# Altium schematic sheet POE_PSU.SchDoc
size A3; SheetNumber: 15; SheetTotal: 16
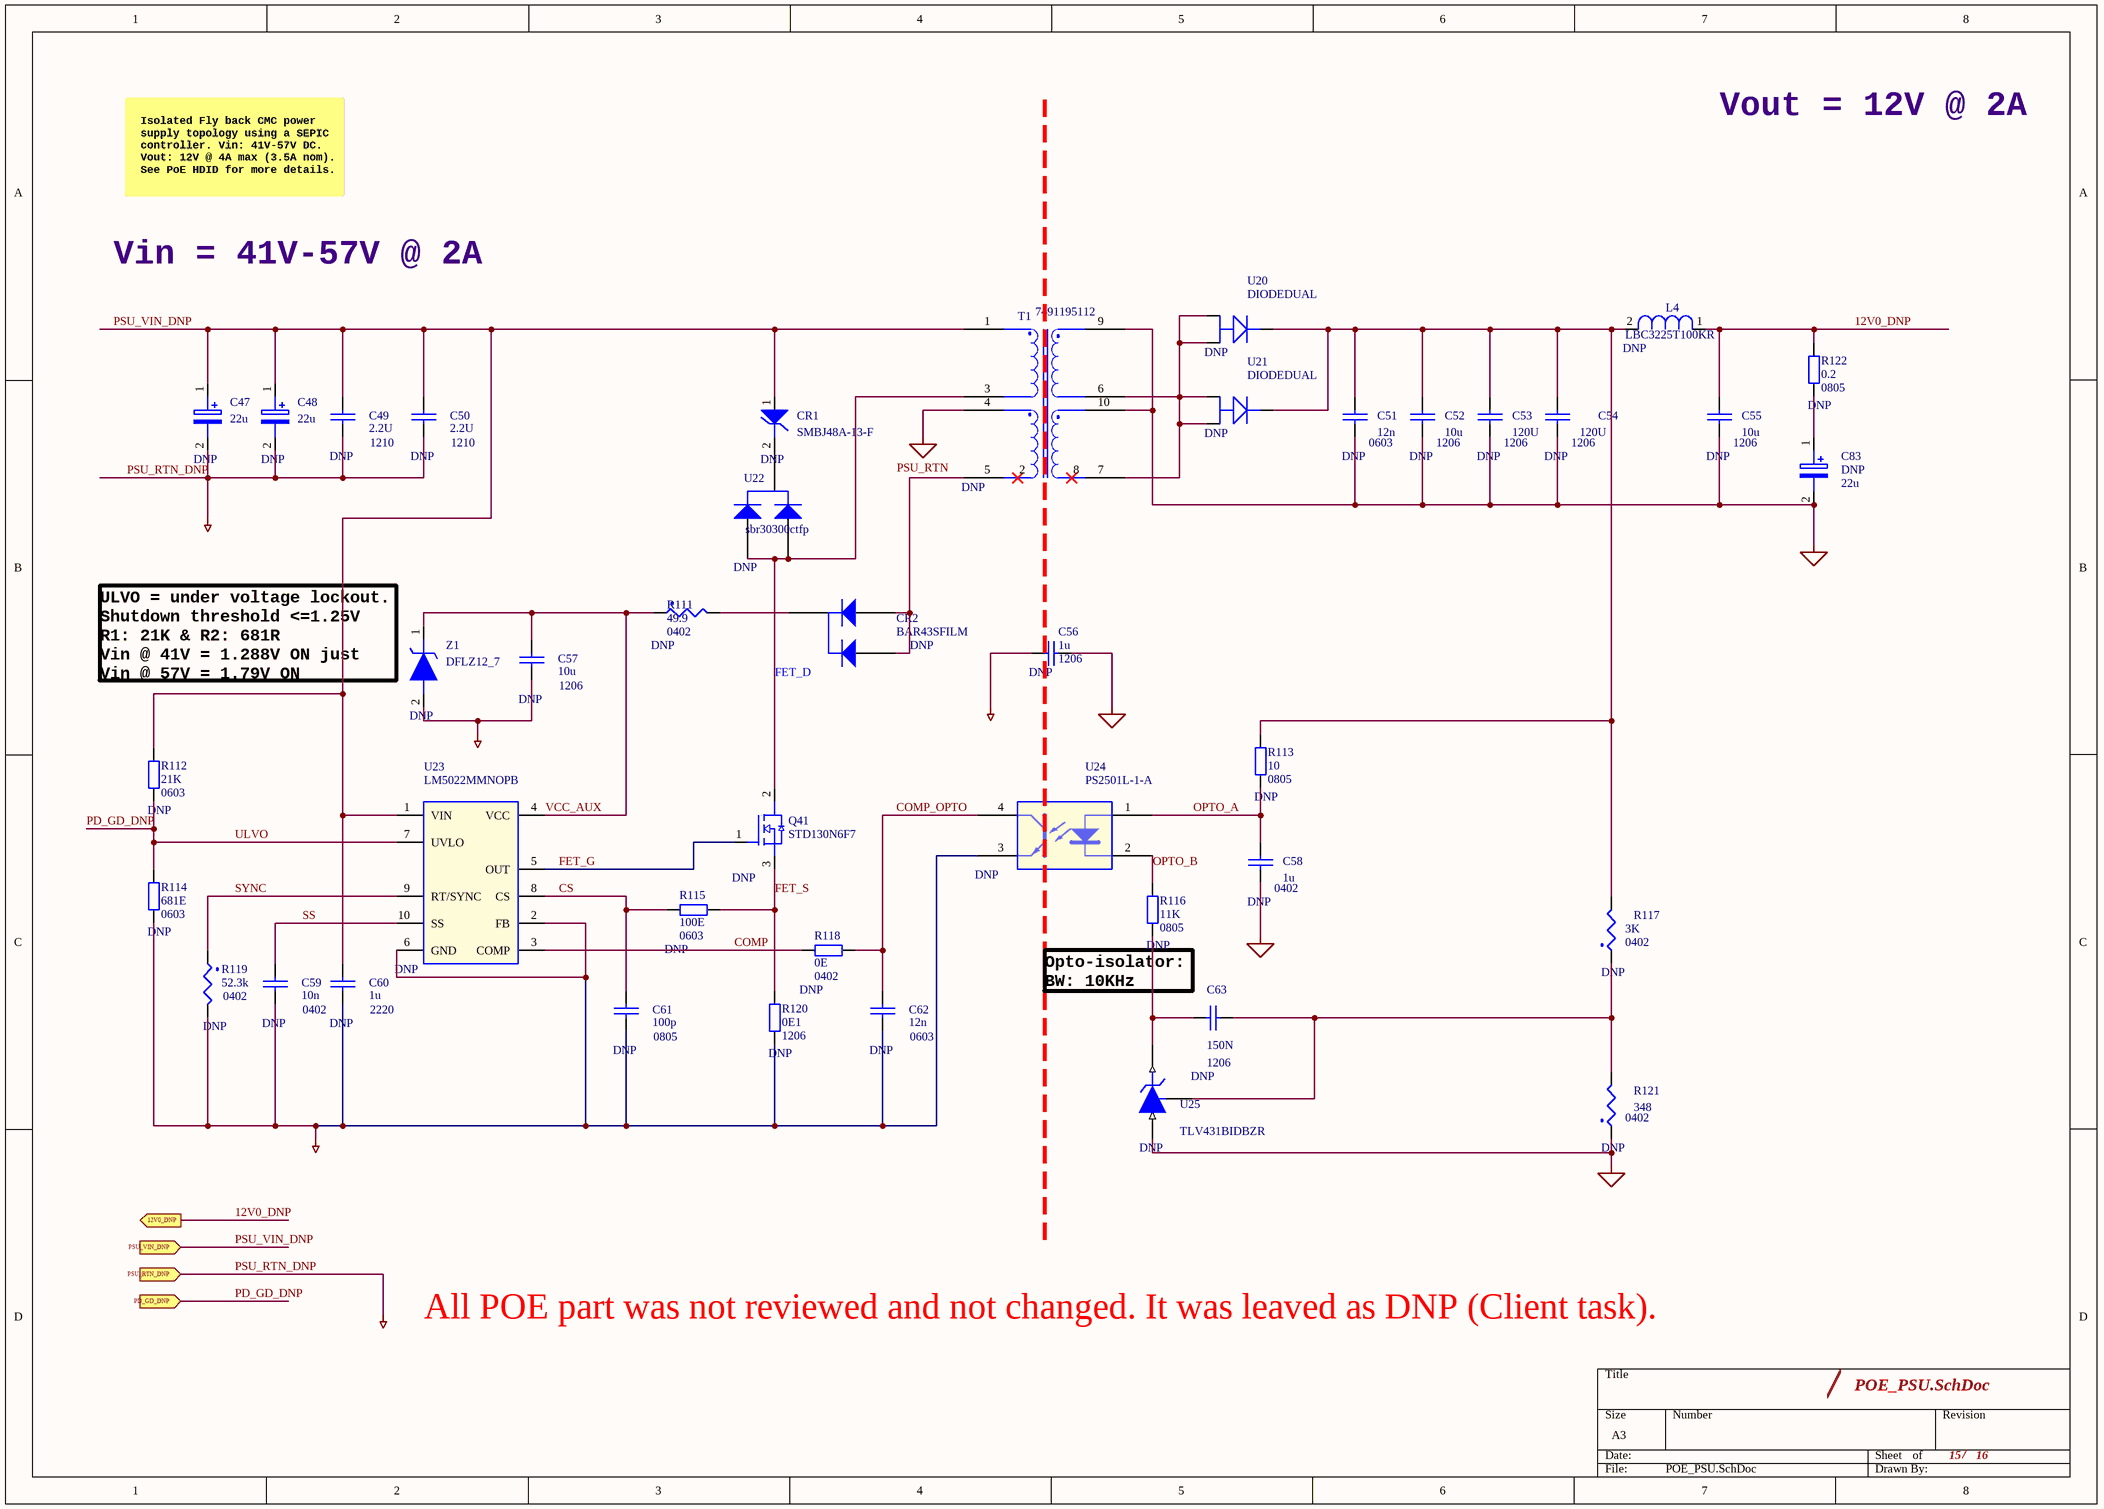
[diagram p0: POE_PSU.SchDoc]

## Parts
C47  22u  [CAPAE830X550N]
C48  22u  [CAPAE830X550N]
C49  2.2U  Foot Print Type: 1210  [cap_sm_1210]
C50  2.2U  Foot Print Type: 1210  [cap_sm_1210]
C51  12n  Foot Print Type: 0603  [c_cs_0603]
C52  10u  Foot Print Type: 1206  [cap_sm_1206]
C53  120U  Foot Print Type: 1206  [cap_sm_1206]
C54  120U  Foot Print Type: 1206  [cap_sm_1206]
C55  10u  Foot Print Type: 1206  [cap_sm_1206]
C56  1u  Foot Print Type: 1206  [cap_sm_1206]
C57  10u  Foot Print Type: 1206  [cap_sm_1206]
C58  1u  Foot Print Type: 0402  [c_np_0402]
C59  10n  Foot Print Type: 0402  [c_np_0402]
C60  1u  Foot Print Type: 2220  [cap_sm_2220]
C61  100p  Foot Print Type: 0805  [cap_sm_0805]
C62  12n  Foot Print Type: 0603  [c_cs_0603]
C63  150N  Foot Print Type: 1206  [cap_sm_1206]
C83  22u  [CAPAE830X550N]
CR1  SMBJ48A-13-F  [SMB_DIO]
CR2  BAR43SFILM  [SOT23-3L_STM]
L4  LBC3225T100KR  [IND_TAIYO_LBC3225_TAY]
Q41  STD130N6F7  [DPAK228P987X240-3N]
R111  49.9  Foot Print Size: 0402  [r_sm_0402_r]
R112  Resistance: 21K  SIZE2: 0603  [RESC160X80X55L30]
R113  Resistance: 10  Size2: 0805  [RESC200X125X60L40]
R114  Resistance: 681E  Package: 0603  [RESC160X80X55L30]
R115  Resistance: 100E  Size2: 0603  [RESC160X80X55L30]
R116  Resistance: 11K  Size2: 0805  [RESC200X125X60L40]
R117  3K  Foot Print Size: 0402  [r_sm_0402_r]
R118  Resistance: 0E  Size2: 0402  [RESC100X50X40L25]  (hidden comment: AC0402JR-070RL)
R119  52.3k  Foot Print Size: 0402  [r_sm_0402_r]
R120  Resistance: 0E1  Size2: 1206  [RESC3116X06N]  (hidden comment: RL1206FR-070R1L)
R121  348  Foot Print Size: 0402  [r_sm_0402_r]
R122  Resistance: 0.2  Size2: 0805  [RESC200X125X60L40]
T1  7491195112  [7491195112]
U20  DIODEDUAL  [D2PAK_STM]
U21  DIODEDUAL  [D2PAK_STM]
U22  sbr30300ctfp  [TO254P995X450X1960-3]
U23  LM5022MMNOPB  [SOP50P490X110-10N]
U24  PS2501L-1-A  [DIP-4_REN]
U25  TLV431BIDBZR  [SOT95P237X112-3N]
Z1  DFLZ12_7  [DFLZ127]

## Ports
12V0_DNP (out), PD_GD_DNP (in), PSU_RTN_DNP (in), PSU_VIN_DNP (in)

## Nets
GND_SIGNAL: C51.1 C52.1 C53.1 C54.1 C55.1 C56.2 C58.1 C83.2(M) R121.1 T1.9 T1.10 U25.3(ANODE)
PSU_RTN: T1.4
PSU_RTN_DNP: C47.2(M) C48.2(M) C49.2 C50.2 C56.1 C57.2 C59.2 C60.2 C61.2 C62.2 R114.2 R119.2 R120.1 U23.2(FB) U23.6(GND) U24.3(EMITTER) Z1.2(A) ; port PSU_RTN_DNP  [also labelled 1]
12V0_DNP: C55.2 L4.1 R122.2 ; port 12V0_DNP
COMP: R118.1 U23.3(COMP)
COMP_OPTO: C62.1 R118.2 U24.4(COLLECTOR)
CS: C61.1 R115.2 U23.8(CS)
FET_D: Q41.2(D__1) T1.3 U22.1 U22.3
FET_G: Q41.1(D) U23.5(OUT)
FET_S: Q41.3(G) R115.1 R120.2
OPTO_A: C58.2 R113.1 U24.1(ANODE)
OPTO_B: R116.2 U24.2(CATHODE)
PD_GD_DNP: R112.2 R114.1 U23.7(UVLO) ; port PD_GD_DNP  [also labelled ULVO]
PSU_VIN_DNP: C47.1(P) C48.1(P) C49.1 C50.1 C60.1 CR1.1 R112.1 T1.1 U23.1(VIN) ; port PSU_VIN_DNP
SS: C59.1 U23.10(SS)
SYNC: R119.1 U23.9(RT/SYNC)
VCC_AUX: C57.1 R111.1 U23.4(VCC) Z1.1(K)
NetC51_2: C51.2 C52.2 C53.2 C54.2 L4.2 R113.2 R117.2 U20.3 U21.3
NetC63_1: C63.1 R116.1 U25.2(CATHODE)
NetC63_2: C63.2 R117.1 R121.2 U25.1(REF)
NetC83_1: C83.1(P) R122.1
NetCR1_2: CR1.2 U22.2
NetCR2_1: CR2.1(A2) CR2.3(A1/K2) T1.5
NetCR2_2: CR2.2(K1) R111.2
NetT1_6: T1.6 T1.7 U20.1 U20.2 U21.1 U21.2

Not connected (* = marked no-connect by the designer): T1 2* 8*

## Notes on the sheet
- Isolated Fly back CMC power
  supply topology using a SEPIC
  controller. Vin: 41V-57V DC.
  Vout: 12V @ 4A max (3.5A nom).
  See PoE HDID for more details.
- Vout = 12V @ 2A
- Vin = 41V-57V @ 2A
- (near Z1) ULVO = under voltage lockout.
  Shutdown threshold <=1.25V
  R1: 21K & R2: 681R
  Vin @ 41V = 1.288V ON just
  Vin @ 57V = 1.79V ON
- Opto-isolator:
  BW: 10KHz
- All POE part was not reviewed and not changed. It was leaved as DNP (Client task).
- /

## Library data of the parts
C47 C48 = UWX1H220MCL1GB: Nichicon 22uF 50 V Aluminium Electrolytic Capacitor SMD, WX Series 2000h 8 (Dia.) x 5.4mm; OriginalSymbolOrigin: (0,0); PCB Footprint: cap_sm_1210; DeviceNumbering: Alpha; DeviceDesignator: A; DevicesInPackage: 1; IsHeterogeneous: False; Voltage: 50V; Tollerance: 5%; Height: 5.5 mm; Datasheet Link: http://www.nichicon.co.jp/english/products/pdfs/e-uwx.pdf; Arrow Price/Stock: https://www.arrow.com/en/products/uwx1h220mcl1gb/nichicon; Arrow Part Number: UWX1H220MCL1GB; Mouser Part Number: 647-UWX1H220MCL1; Manufacturer_Part_Number: UWX1H220MCL1GB; Manufacturer_Name: Nichicon; DevicesInView: 1; PackageName: UWX1H220MCL1GB; DNP: DNP
C49-C58 = CAP_NP: CLASS: DISCRETE; Voltage: 50V; Tollerance: 5%; DNP: DNP
  C49 C50: PCB Footprint: cap_sm_1210
  C51: PCB Footprint: c_cs_0603
  C52-C57: PCB Footprint: cap_sm_1206
  C58: PCB Footprint: c_np_0402
C59-C63 = CAP_NP: CLASS: DISCRETE; Voltage: 50V; Tollerance: 1%; DNP: DNP
  C59: PCB Footprint: c_np_0402
  C60: PCB Footprint: cap_sm_2220
  C61: PCB Footprint: cap_sm_0805
  C62: PCB Footprint: c_cs_0603
  C63: PCB Footprint: cap_sm_1206
C83 = UWX1H220MCL1GB: Nichicon 22uF 50 V Aluminium Electrolytic Capacitor SMD, WX Series 2000h 8 (Dia.) x 5.4mm; OriginalSymbolOrigin: (0,0); PCB Footprint: cap_sm_0805; DeviceNumbering: Alpha; DeviceDesignator: A; DevicesInPackage: 1; IsHeterogeneous: False; Tollerance: 5%; Voltage: 50V; Height: 5.5 mm; Datasheet Link: http://www.nichicon.co.jp/english/products/pdfs/e-uwx.pdf; Arrow Price/Stock: https://www.arrow.com/en/products/uwx1h220mcl1gb/nichicon; Arrow Part Number: UWX1H220MCL1GB; Mouser Part Number: 647-UWX1H220MCL1; Manufacturer_Part_Number: UWX1H220MCL1GB; Manufacturer_Name: Nichicon; DevicesInView: 1; PackageName: UWX1H220MCL1GB; DNP: DNP
CR1 = SMBJ48A-13-F: Mfr_Name: Diodes Inc; Copyright: Copyright (C) 2022 Ultra Librarian. All rights reserved.; Manufacturer_Part_Number: SMBJ48A-13-F; PCB Footprint: SMB_DIO; DNP: DNP
CR2 = BAR43SFILM: Mfr_Name: STMicroelectronics; Manufacturer_Part_Number: BAR43SFILM; Copyright: Copyright (C) 2022 Ultra Librarian. All rights reserved.; PCB Footprint: SOT23-3L_STM; DNP: DNP
L4 = LBC3225T100KR: Mfr_Name: Taiyo Yuden; Manufacturer_Part_Number: 74437324010; PCB Footprint: IND_74437324010; Copyright: Copyright (C) 2022 Ultra Librarian. All rights reserved.; DNP: DNP
R111 R121 = SMD_RESISTOR: Voltage: 50V; Tollerance: 0.1%; PCB Footprint: r_sm_0402_r; DNP: DNP
R112 = CMP-001-0628-7: RES 21K OHM 1/10W 0603; Power: 100mW; Temperature Coefficient: ±100ppm; Op Temp max: 155°C; Op Temp min: -55°C; Ratings: -; Size: 1.60mm x 0.80mm; Composition: Thick Film; Package: 0603 (1608 Metric); Mounting Type: SM; Height max: 550µm; Component Type: Chip Resistor; DNP: DNP
R113 = CMP-001-0694-4: RES 10 OHM 1% 1/8W 0805; Manufacturer: YAGEO; Temperature Coefficient: ±100ppm; Power: 125mW; Op Temp min: -55°C; Op Temp max: 155°C; Package: 0805 (2012 Metric); Size: 2.00mm x 1.25mm; ComponentLink1Description: Datasheet; ComponentLink3Description: Digikey; ComponentLink2URL: https://eu.mouser.com/ProductDetail/YAGEO/RC0805FR-0727RL?qs=fRxXYNj8ftGXrQSQGs8%252BUg%3D%3D; Mounting Type: SM; Composition: Thick Film; ComponentLink3URL: https://www.digikey.com/en/products/detail/yageo/RC0805FR-0727RL/727779; Tolerance: 1%; Height max: 600µm; ComponentLink2Description: Mouser; Ratings: -; ComponentLink1URL: https://www.yageo.com/upload/media/product/productsearch/datasheet/rchip/PYu-RC_Group_51_RoHS_L_12.pdf; Component Type: Chip Resistor; DNP: DNP
R114 = CMP-001-0628-7: RES 681 OHM 1/10W 0603; Power: 100mW; Temperature Coefficient: ±100ppm; Op Temp max: 155°C; Op Temp min: -55°C; Ratings: -; Size: 1.60mm x 0.80mm; Composition: Thick Film; Mounting Type: SM; Height max: 550µm; Component Type: Chip Resistor; DNP: DNP
R115 = CMP-001-0628-7: RES 100 OHM 1/10W 0603; Power: 100mW; Temperature Coefficient: ±100ppm; Op Temp max: 155°C; Op Temp min: -55°C; Ratings: -; Size: 1.60mm x 0.80mm; Composition: Thick Film; Package: 0603 (1608 Metric); Mounting Type: SM; Height max: 550µm; Component Type: Chip Resistor; DNP: DNP
R116 = CMP-001-0694-4: RES 11K OHM 1% 1/8W 0805; Manufacturer: YAGEO; Temperature Coefficient: ±100ppm; Power: 125mW; Op Temp min: -55°C; Op Temp max: 155°C; Package: 0805 (2012 Metric); Size: 2.00mm x 1.25mm; ComponentLink1Description: Datasheet; ComponentLink3Description: Digikey; ComponentLink2URL: https://eu.mouser.com/ProductDetail/YAGEO/RC0805FR-0727RL?qs=fRxXYNj8ftGXrQSQGs8%252BUg%3D%3D; Mounting Type: SM; Composition: Thick Film; ComponentLink3URL: https://www.digikey.com/en/products/detail/yageo/RC0805FR-0727RL/727779; Tolerance: 1%; Height max: 600µm; ComponentLink2Description: Mouser; Ratings: -; ComponentLink1URL: https://www.yageo.com/upload/media/product/productsearch/datasheet/rchip/PYu-RC_Group_51_RoHS_L_12.pdf; Component Type: Chip Resistor; DNP: DNP
R117 R119 = SMD_RESISTOR: Tollerance: 1%; Voltage: 50V; PCB Footprint: r_sm_0402_r; DNP: DNP
R118 = CMP-001-0484-6: RES SMD 0 OHM JUMPER 1/16W 0402; Manufacturer: YAGEO; Power: 63mW; Op Temp min: -55°C; Temperature Coefficient: ±100ppm; Op Temp max: 155°C; ComponentLink3URL: https://www.digikey.com/en/products/detail/yageo/RC0402FR-0727RL/5280946; ComponentLink2Description: Mouser; Ratings: -; Tolerance: Jumper; Height max: 400µm; MPN: AC0402JR-070RL; ComponentLink1URL: https://www.yageo.com/upload/media/product/productsearch/datasheet/rchip/PYu-RC_Group_51_RoHS_L_12.pdf; Size: 1.00mm x 0.50mm; Composition: Thick Film; Package: 0402 (1005 Metric); ComponentLink3Description: Digikey; Mounting Type: SM; ComponentLink2URL: https://eu.mouser.com/ProductDetail/YAGEO/RC0402FR-0727RL?qs=UOUeRUa%252B8Wlb37UyFHw9Bw%3D%3D; ComponentLink1Description: Datasheet; Component Type: Chip Resistor; DNP: DNP
R120 = RC_1206: RES 0.1 OHM 1% 1/4W 1206; MF: YAGEO; Power: 0.25W; Datasheet: https://www.yageo.com/upload/media/product/products/datasheet/rchip/PYu-RC_Group_51_RoHS_L_12.pdf; DigiKey: https://www.digikey.com/en/products/detail/yageo/RC1206JR-070RL/729184; Package: 1206 (3216 Metric); MPN: RL1206FR-070R1L; DNP: DNP
R122 = CMP-001-0694-4: RES 0.2 OHM 1% 1/8W 0805; Manufacturer: YAGEO; Temperature Coefficient: ±100ppm; Power: 125mW; Op Temp min: -55°C; Op Temp max: 155°C; Package: 0805 (2012 Metric); Size: 2.00mm x 1.25mm; ComponentLink1Description: Datasheet; ComponentLink3Description: Digikey; ComponentLink2URL: https://eu.mouser.com/ProductDetail/YAGEO/RC0805FR-0727RL?qs=fRxXYNj8ftGXrQSQGs8%252BUg%3D%3D; Mounting Type: SM; Composition: Thick Film; ComponentLink3URL: https://www.digikey.com/en/products/detail/yageo/RC0805FR-0727RL/727779; Tolerance: 1%; Height max: 600µm; ComponentLink2Description: Mouser; Ratings: -; ComponentLink1URL: https://www.yageo.com/upload/media/product/productsearch/datasheet/rchip/PYu-RC_Group_51_RoHS_L_12.pdf; Component Type: Chip Resistor; DNP: DNP
U20 U21 = STPS20M100SG-TR: Mfr_Name: STMicroelectronics; Copyright: Copyright (C) 2022 Ultra Librarian. All rights reserved.; Manufacturer_Part_Number: STPS20M100SG-TR; PCB Footprint: D2PAK_STM; DNP: DNP
U23 = LM5022MMNOPB: OriginalSymbolOrigin: (-50000,70000); PCB Footprint: SOP50P490X110-10N; DNP: DNP
U24 = PS2501-1-A: Mfr_Name: Renesas Electronics; PCB Footprint: SOIC_1L-1-A; Copyright: Copyright (C) 2022 Ultra Librarian. All rights reserved.; Manufacturer_Part_Number: PS2501L-1-A; DNP: DNP
U25 = TLV431BIDBZR: OriginalSymbolOrigin: (-70000,20000); PCB Footprint: SOT95P237X112-3N; DNP: DNP
Z1 = DFLZ12_7: Zener Diodes; Manufacturer_Part_Number: DFLZ12-7; Manufacturer_Name: Diodes Inc.; OriginalSymbolOrigin: (0,0); DeviceNumbering: Alpha; DeviceDesignator: A; DevicesInPackage: 1; IsHeterogeneous: False; Height: 1 mm; Datasheet Link: https://ms.componentsearchengine.com/Datasheets/1/DFLZ12-7.pdf; Arrow Price/Stock: https://www.arrow.com/en/products/dflz12-7/diodes-incorporated?region=nac; Arrow Part Number: DFLZ12-7; Mouser Part Number: 621-DFLZ12-7; PCB Footprint: DFLZ127; DevicesInView: 1; PackageName: DFLZ12_7; DNP: DNP
Q41 = STD130N6F7: PCB Footprint: DPAK228P987X240-3N; DNP: DNP
T1 = 7491195112: PCB Footprint: 7491195112; DNP: DNP
U22 = sbr30300ctfp: PCB Footprint: TO254P995X450X1960-3; DNP: DNP